# Altium schematic sheet USBC_Protection.SchDoc
size A4; SheetNumber: 1; SheetTotal: 4
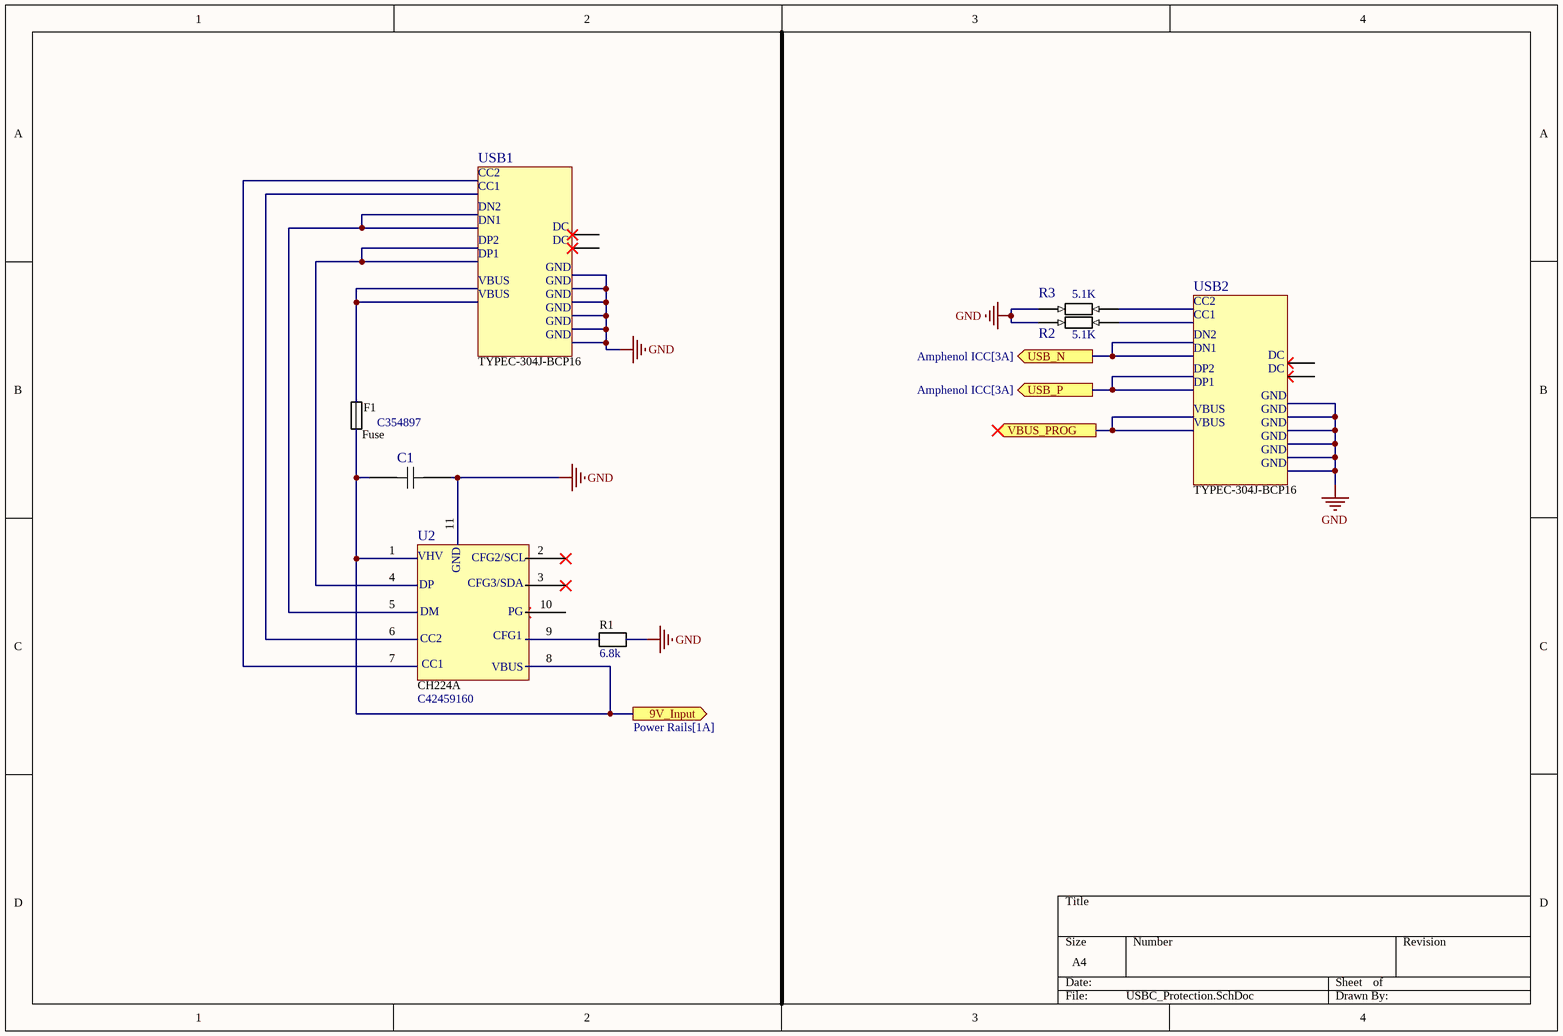
[diagram p0: USBC_Protection.SchDoc]

## Parts
C1  CC0603KRX5R9BB105  [C0603]  (value not drawn)
F1  Fuse  Name: C354897  [F1206]
R1  value 6.8k  [R0603]  (hidden comment: CQ03WAJ0682T5E)
R2  value 5.1K  [R0603]  (hidden comment: 0603WAF5101T5E)
R3  value 5.1K  [R0603]  (hidden comment: 0603WAF5101T5E)
U2  CH224A  Name: C42459160  [ESSOP-10_L4.9-W3.9-P1.0-LS6.0-TL-EP]
USB1  TYPEC-304J-BCP16  [USB-C-SMD_TYPEC-304J-BCP16]
USB2  TYPEC-304J-BCP16  [USB-C-SMD_TYPEC-304J-BCP16]

## Ports
9V_Input (out, see Power Rails[1A]), USB_N (out, see Amphenol ICC[3A]), USB_P (out, see Amphenol ICC[3A]), VBUS_PROG (out)

## Nets
GND: C1.1 R1.2 R2.1 R3.1 U2.11 USB1.13(GND) USB1.14(GND) USB1.15(GND) USB1.16(GND) USB1.A1B12(GND) USB1.B1A12(GND) USB2.13(GND) USB2.14(GND) USB2.15(GND) USB2.16(GND) USB2.A1B12(GND) USB2.B1A12(GND)
9V_Input: C1.2 F1.1 U2.1 U2.8 ; port 9V_Input
USB_N: USB2.A7(DN1) USB2.B7(DN2) ; port USB_N
USB_P: USB2.A6(DP1) USB2.B6(DP2) ; port USB_P
VBUS_PROG: USB2.A4B9(VBUS) USB2.B4A9(VBUS) ; port VBUS_PROG
NetF1_2: F1.2 USB1.A4B9(VBUS) USB1.B4A9(VBUS)
NetR1_1: R1.1 U2.9
NetR2_2: R2.2 USB2.A5(CC1)
NetR3_2: R3.2 USB2.B5(CC2)
NetU2_4: U2.4 USB1.A6(DP1) USB1.B6(DP2)
NetU2_5: U2.5 USB1.A7(DN1) USB1.B7(DN2)
NetU2_6: U2.6 USB1.A5(CC1)
NetU2_7: U2.7 USB1.B5(CC2)

Not connected (* = marked no-connect by the designer): U2 2* 3* 10*; USB1 A8(SBU1)* B8(SBU2)*; USB2 A8(SBU1)* B8(SBU2)*

## Notes on the sheet
- (in symbol CH224A) VHV; CFG2/SCL; GND; DP; CFG3/SDA; DM; PG; CC2; CFG1; CC1; VBUS
- (in symbol TYPEC-304J-BCP16) DC

## Library data of the parts
C1 = CC0603KRX5R9BB105: 1uF ±10% 50V Ceramic Capacitor X5R 0603; Name: C128624; Value: 1uF; Source: JLCPCB
F1 = 1206T3A63V: 3A Fuse Surface Mount 1206; Source: JLCPCB
R1 = CQ03WAJ0682T5E: 6.8kÎ© Â±5% 100mW 0603 Thick Film Resistor AEC-Q200; Name: C2770993; Source: JLCPCB
R2 R3 = 0603WAF5101T5E: 5.1kÎ© Â±1% 100mW 0603 Thick Film Resistor; Name: C23186; Source: JLCPCB
U2 = CH224A: Power Receiver Controller 1C 140W ESSOP-10 Power Management - Specialized RoHS; Source: JLCPCB
USB1 USB2 = TYPEC-304J-BCP16: USB-C (USB TYPE-C) Receptacle Connector 16 Position Surface Mount, Right Angle; Name: C2835315; Source: JLCPCB